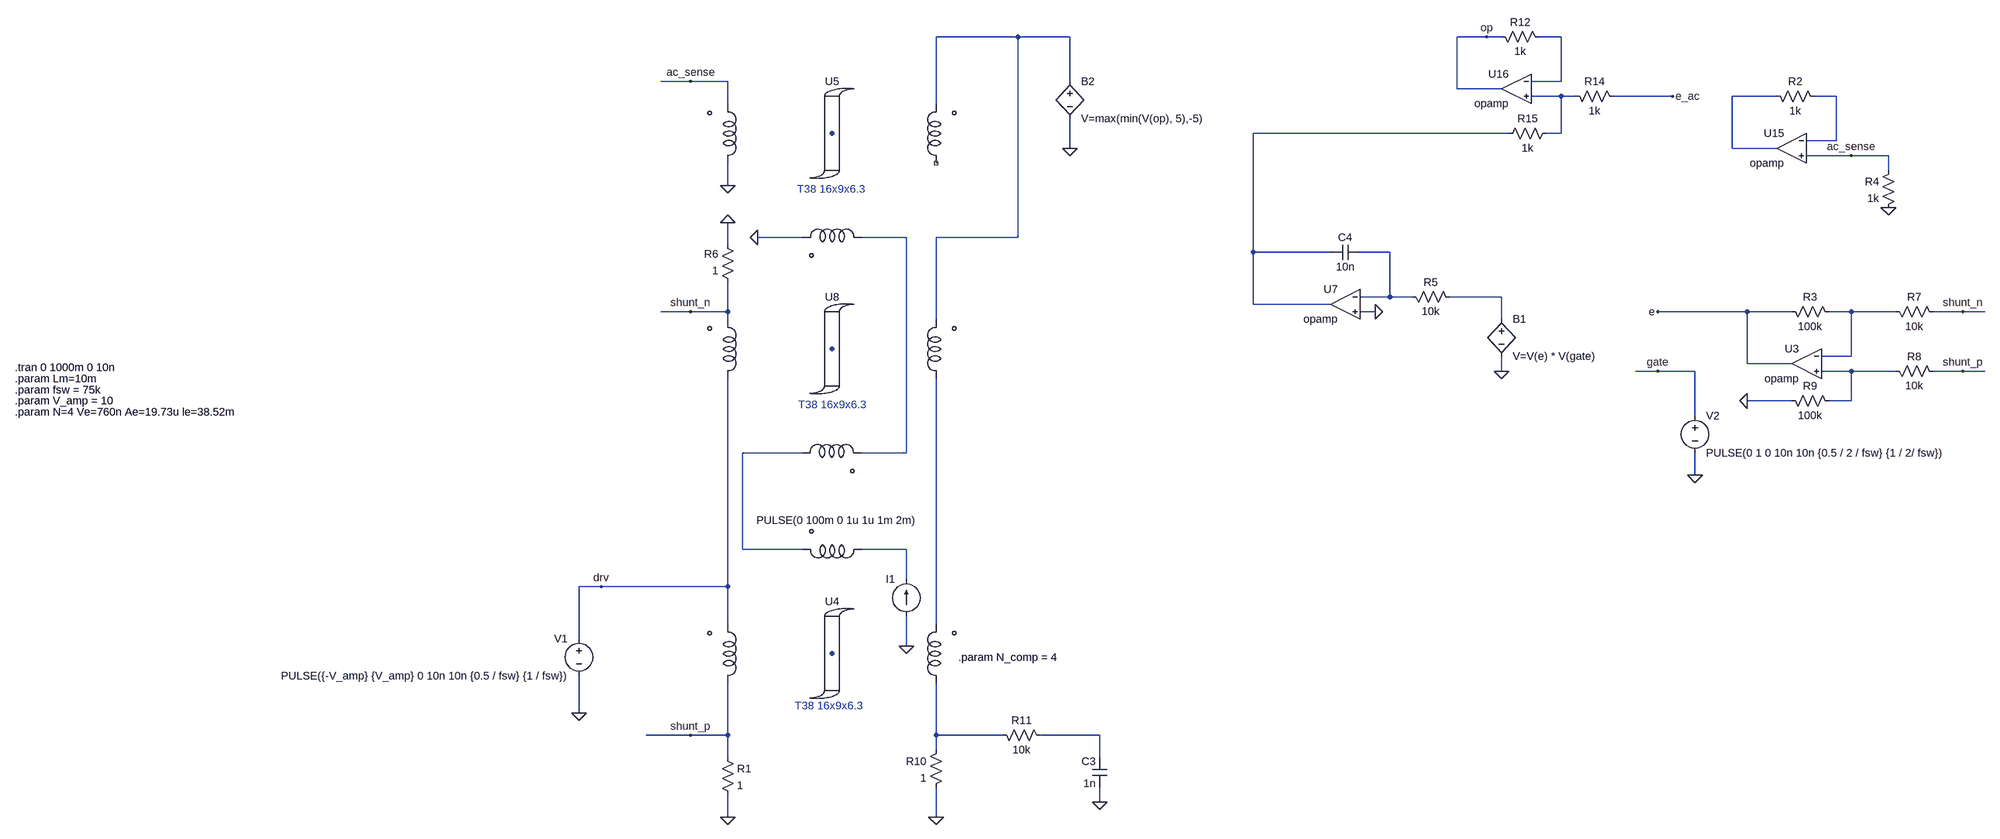
[diagram p0: schematic closed_loop_and_AC.asc]
closed_loop_and_AC.asc, the LTspice schematic file:
Version 4
SHEET 1 3936 1332
WIRE -192 -3136 -368 -3136
WIRE -80 -3136 -192 -3136
WIRE 1248 -3136 1184 -3136
WIRE 1280 -3136 1248 -3136
WIRE 1408 -3136 1360 -3136
WIRE -896 -3040 -960 -3040
WIRE -816 -3040 -896 -3040
WIRE -80 -3040 -80 -3136
WIRE 1408 -3040 1408 -3136
WIRE 1408 -3040 1344 -3040
WIRE 1184 -3024 1184 -3136
WIRE 1280 -3024 1184 -3024
WIRE 1408 -3008 1344 -3008
WIRE 1440 -3008 1408 -3008
WIRE 1648 -3008 1520 -3008
WIRE 1872 -3008 1776 -3008
WIRE 2000 -3008 1952 -3008
WIRE -816 -2992 -816 -3040
WIRE -368 -2992 -368 -3136
WIRE 1296 -2928 704 -2928
WIRE 1408 -2928 1408 -3008
WIRE 1408 -2928 1376 -2928
WIRE 2000 -2912 2000 -3008
WIRE 2000 -2912 1936 -2912
WIRE -80 -2896 -80 -2960
WIRE 1776 -2896 1776 -3008
WIRE 1872 -2896 1776 -2896
WIRE 2032 -2880 1936 -2880
WIRE 2112 -2880 2032 -2880
WIRE 2112 -2848 2112 -2880
WIRE -816 -2816 -816 -2864
WIRE -656 -2704 -752 -2704
WIRE -432 -2704 -528 -2704
WIRE -192 -2704 -192 -3136
WIRE -192 -2704 -368 -2704
WIRE -816 -2688 -816 -2736
WIRE 704 -2672 704 -2928
WIRE 912 -2672 704 -2672
WIRE 1040 -2672 976 -2672
WIRE 1040 -2576 1040 -2672
WIRE 1040 -2576 976 -2576
WIRE 1088 -2576 1040 -2576
WIRE 1280 -2576 1168 -2576
WIRE 704 -2560 704 -2672
WIRE 912 -2560 704 -2560
WIRE -896 -2544 -960 -2544
WIRE -816 -2544 -816 -2608
WIRE -816 -2544 -896 -2544
WIRE 1008 -2544 976 -2544
WIRE 1808 -2544 1616 -2544
WIRE 1904 -2544 1808 -2544
WIRE 2032 -2544 1984 -2544
WIRE 2128 -2544 2032 -2544
WIRE 2272 -2544 2208 -2544
WIRE 2320 -2544 2272 -2544
WIRE -816 -2528 -816 -2544
WIRE -368 -2528 -368 -2704
WIRE 1280 -2528 1280 -2576
WIRE 2032 -2448 2032 -2544
WIRE 2032 -2448 1968 -2448
WIRE 1808 -2432 1808 -2544
WIRE 1904 -2432 1808 -2432
WIRE 1280 -2416 1280 -2448
WIRE 1616 -2416 1568 -2416
WIRE 1696 -2416 1616 -2416
WIRE 2032 -2416 1968 -2416
WIRE 2128 -2416 2032 -2416
WIRE 2272 -2416 2208 -2416
WIRE 2320 -2416 2272 -2416
WIRE 1904 -2352 1808 -2352
WIRE 2032 -2352 2032 -2416
WIRE 2032 -2352 1984 -2352
WIRE 1696 -2320 1696 -2416
WIRE -656 -2240 -784 -2240
WIRE -432 -2240 -432 -2704
WIRE -432 -2240 -528 -2240
WIRE 1696 -2192 1696 -2240
WIRE -784 -2032 -784 -2240
WIRE -656 -2032 -784 -2032
WIRE -432 -2032 -528 -2032
WIRE -432 -1968 -432 -2032
WIRE -1088 -1952 -1136 -1952
WIRE -816 -1952 -816 -2400
WIRE -816 -1952 -1088 -1952
WIRE -816 -1872 -816 -1952
WIRE -368 -1872 -368 -2400
WIRE -1136 -1840 -1136 -1952
WIRE -432 -1824 -432 -1888
WIRE -1136 -1680 -1136 -1760
WIRE -896 -1632 -992 -1632
WIRE -816 -1632 -816 -1744
WIRE -816 -1632 -896 -1632
WIRE -368 -1632 -368 -1744
WIRE -224 -1632 -368 -1632
WIRE -16 -1632 -144 -1632
WIRE -368 -1600 -368 -1632
WIRE -816 -1584 -816 -1632
WIRE -16 -1584 -16 -1632
WIRE -16 -1488 -16 -1520
WIRE -816 -1456 -816 -1504
WIRE -368 -1456 -368 -1520
FLAG -1136 -1680 0
FLAG 1696 -2192 0
FLAG -1088 -1952 drv
FLAG -816 -2736 0
FLAG 1808 -2352 0
FLAG -896 -1632 shunt_p
FLAG 2272 -2416 shunt_p
FLAG 2272 -2544 shunt_n
FLAG -896 -2544 shunt_n
FLAG -368 -1456 0
FLAG -816 -1456 0
FLAG 1616 -2416 gate
FLAG 1616 -2544 e
FLAG 1280 -2416 0
FLAG -432 -1824 0
FLAG 1008 -2544 0
FLAG -80 -2896 0
FLAG -16 -1488 0
FLAG -752 -2704 0
FLAG -816 -2816 0
FLAG -896 -3040 ac_sense
FLAG 2032 -2880 ac_sense
FLAG 1648 -3008 e_ac
FLAG 1248 -3136 op
FLAG 2112 -2768 0
SYMBOL voltage -1136 -1856 M0
WINDOW 123 0 0 Left 0
WINDOW 39 0 0 Left 0
SYMATTR InstName V1
SYMATTR Value PULSE({-V_amp} {V_amp} 0 10n 10n {0.5 / fsw} {1 / fsw})
SYMBOL Winding -816 -1808 R0
WINDOW 0 -93 39 Invisible 2
WINDOW 39 -225 76 Invisible 2
WINDOW 3 -98 42 Invisible 2
SYMATTR InstName U1
SYMATTR SpiceLine n={N} L=10n Rs=1m Rp=100Meg
SYMBOL Core_Chan -592 -1808 R0
WINDOW 3 41 88 Invisible 2
WINDOW 39 13 112 Invisible 2
WINDOW 0 1 -96 Bottom 2
SYMATTR SpiceLine Bs=0.43 Br=0.1 Hc=8
SYMATTR InstName U4
SYMATTR SpiceLine2 A={Ae} Lm={le} Lg=0 Rp=1Meg
SYMBOL res -832 -1600 R0
SYMATTR InstName R1
SYMATTR Value 1
SYMBOL Winding -592 -2032 M90
WINDOW 0 -93 39 Invisible 2
WINDOW 39 -196 73 Invisible 2
WINDOW 3 -98 42 Invisible 2
SYMATTR InstName U2
SYMATTR SpiceLine n={1} L=10n Rs=1m Rp=100k
SYMBOL current -432 -1888 R180
WINDOW 0 24 80 Left 2
WINDOW 3 150 207 Center 2
WINDOW 123 0 0 Left 0
WINDOW 39 0 0 Left 0
SYMATTR InstName I1
SYMATTR Value PULSE(0 100m 0 1u 1u 1m 2m)
SYMBOL voltage 1696 -2336 R0
WINDOW 123 0 0 Left 0
WINDOW 39 0 0 Left 0
SYMATTR InstName V2
SYMATTR Value PULSE(0 1 0 10n 10n {0.5 / 2 / fsw} {1 / 2/ fsw})
SYMBOL opamp 944 -2624 M0
SYMATTR InstName U7
SYMBOL Winding -816 -2464 R0
WINDOW 0 221 26 Invisible 2
WINDOW 39 259 -62 Invisible 2
WINDOW 3 214 -32 Invisible 2
SYMATTR InstName U6
SYMATTR SpiceLine n={N} L=10n Rs=1m Rp=100Meg
SYMBOL Core_Chan -592 -2464 R0
WINDOW 3 41 88 Invisible 2
WINDOW 39 13 112 Invisible 2
WINDOW 0 1 -96 Bottom 2
SYMATTR SpiceLine Bs=0.43 Br=0.1 Hc=8
SYMATTR InstName U8
SYMATTR SpiceLine2 A={Ae} Lm={le} Lg=0 Rp=1Meg
SYMBOL res -800 -2592 R180
WINDOW 0 36 76 Left 2
WINDOW 3 36 40 Left 2
SYMATTR InstName R6
SYMATTR Value 1
SYMBOL Winding -592 -2240 M270
WINDOW 0 -93 39 Invisible 2
WINDOW 39 -196 73 Invisible 2
WINDOW 3 -98 42 Invisible 2
SYMATTR InstName U9
SYMATTR SpiceLine n={1} L=10n Rs=1m Rp=100k
SYMBOL opamp 1936 -2496 M0
SYMATTR InstName U3
SYMBOL res 1888 -2560 M90
WINDOW 0 0 56 VBottom 2
WINDOW 3 32 56 VTop 2
SYMATTR InstName R3
SYMATTR Value 100k
SYMBOL res 2112 -2560 M90
WINDOW 0 0 56 VBottom 2
WINDOW 3 32 56 VTop 2
SYMATTR InstName R7
SYMATTR Value 10k
SYMBOL res 2112 -2432 M90
WINDOW 0 0 56 VBottom 2
WINDOW 3 32 56 VTop 2
SYMATTR InstName R8
SYMATTR Value 10k
SYMBOL res 1888 -2368 M90
WINDOW 0 0 56 VBottom 2
WINDOW 3 32 56 VTop 2
SYMATTR InstName R9
SYMATTR Value 100k
SYMBOL Winding -368 -1808 M0
WINDOW 0 -93 39 Invisible 2
WINDOW 39 -225 76 Invisible 2
WINDOW 3 -98 42 Invisible 2
SYMATTR InstName U10
SYMATTR SpiceLine n={N_comp} L=10n Rs=1m Rp=100Meg
SYMBOL Winding -368 -2464 M0
WINDOW 0 221 26 Invisible 2
WINDOW 39 259 -62 Invisible 2
WINDOW 3 214 -32 Invisible 2
SYMATTR InstName U11
SYMATTR SpiceLine n={N_comp} L=10n Rs=1m Rp=100Meg
SYMBOL res -352 -1616 M0
SYMATTR InstName R10
SYMATTR Value 1
SYMBOL bv 1280 -2544 R0
SYMATTR InstName B1
SYMATTR Value V=V(e) * V(gate)
SYMBOL res 1072 -2592 M90
WINDOW 0 0 56 VBottom 2
WINDOW 3 32 56 VTop 2
SYMATTR InstName R5
SYMATTR Value 10k
SYMBOL bv -80 -3056 R0
SYMATTR InstName B2
SYMATTR Value V=max(min(V(op), 5),-5)
SYMBOL cap 976 -2688 R90
WINDOW 0 0 32 VBottom 2
WINDOW 3 32 32 VTop 2
SYMATTR InstName C4
SYMATTR Value 10n
SYMBOL cap 0 -1584 M0
SYMATTR InstName C3
SYMATTR Value 1n
SYMBOL res -240 -1648 M90
WINDOW 0 0 56 VBottom 2
WINDOW 3 32 56 VTop 2
SYMATTR InstName R11
SYMATTR Value 10k
SYMBOL Core_Chan -592 -2928 R0
WINDOW 3 41 88 Invisible 2
WINDOW 39 13 112 Invisible 2
WINDOW 0 1 -96 Bottom 2
SYMATTR SpiceLine Bs=0.43 Br=0.1 Hc=8
SYMATTR InstName U5
SYMATTR SpiceLine2 A={Ae} Lm={le} Lg=0 Rp=1Meg
SYMBOL Winding -592 -2704 R270
WINDOW 0 -93 39 Invisible 2
WINDOW 39 -196 73 Invisible 2
WINDOW 3 -98 42 Invisible 2
SYMATTR InstName U12
SYMATTR SpiceLine n={1} L=10n Rs=1m Rp=100k
SYMBOL Winding -368 -2928 M0
WINDOW 0 221 26 Invisible 2
WINDOW 39 259 -62 Invisible 2
WINDOW 3 214 -32 Invisible 2
SYMATTR InstName U13
SYMATTR SpiceLine n={20} L=10n Rs=1m Rp=100Meg
SYMBOL Winding -816 -2928 R0
WINDOW 0 221 26 Invisible 2
WINDOW 39 259 -62 Invisible 2
WINDOW 3 214 -32 Invisible 2
SYMATTR InstName U14
SYMATTR SpiceLine n={20} L=10n Rs=1m Rp=100Meg
SYMBOL opamp 1904 -2960 M0
SYMATTR InstName U15
SYMBOL res 1856 -3024 M90
WINDOW 0 0 56 VBottom 2
WINDOW 3 32 56 VTop 2
SYMATTR InstName R2
SYMATTR Value 1k
SYMBOL opamp 1312 -3088 M0
SYMATTR InstName U16
SYMBOL res 1264 -3152 M90
WINDOW 0 0 56 VBottom 2
WINDOW 3 32 56 VTop 2
SYMATTR InstName R12
SYMATTR Value 1k
SYMBOL res 1424 -3024 M90
WINDOW 0 0 56 VBottom 2
WINDOW 3 32 56 VTop 2
SYMATTR InstName R14
SYMATTR Value 1k
SYMBOL res 1392 -2944 R90
WINDOW 0 0 56 VBottom 2
WINDOW 3 32 56 VTop 2
SYMATTR InstName R15
SYMATTR Value 1k
SYMBOL res 2128 -2864 M0
SYMATTR InstName R4
SYMATTR Value 1k
TEXT -2856 -2424 Left 2 !.tran 0 1000m 0 10n
TEXT -2856 -2328 Left 2 !.param N=4 Ve=760n Ae=19.73u le=38.52m
TEXT -2856 -2400 Left 2 !.param Lm=10m
TEXT -2856 -2376 Left 2 !.param fsw = 75k
TEXT -2856 -2352 Left 2 !.param V_amp = 10
TEXT -672 -1696 Left 2 ;T38 16x9x6.3
TEXT -320 -1800 Left 2 !.param N_comp = 4
TEXT -664 -2344 Left 2 ;T38 16x9x6.3
TEXT -520 -2808 Right 2 ;T38 16x9x6.3

The netlist it stands for:
* closed_loop_and_AC.asc
V1 drv 0 PULSE({-V_amp} {V_amp} 0 10n 10n {0.5 / fsw} {1 / fsw})
XU1 shunt_p drv P001 Winding n={N} L=10n Rs=1m Rp=100Meg  ; pins s f c
XU4 P001 Core_Chan Bs=0.43 Br=0.1 Hc=8 A={Ae} Lm={le} Lg=0 Rp=1Meg  ; pins C
R1 shunt_p 0 1
XU2 N013 N012 P001 Winding n={1} L=10n Rs=1m Rp=100k  ; pins s f c
I1 0 N013 PULSE(0 100m 0 1u 1u 1m 2m)
V2 gate 0 PULSE(0 1 0 10n 10n {0.5 / 2 / fsw} {1 / 2/ fsw})
XU7 N008 0 N006 opamp Aol=100K GBW=10Meg  ; pins invin noninvin out
XU6 drv shunt_n P002 Winding n={N} L=10n Rs=1m Rp=100Meg  ; pins s f c
XU8 P002 Core_Chan Bs=0.43 Br=0.1 Hc=8 A={Ae} Lm={le} Lg=0 Rp=1Meg  ; pins C
R6 shunt_n 0 1
XU9 N012 N007 P002 Winding n={1} L=10n Rs=1m Rp=100k  ; pins s f c
XU3 N010 N011 e opamp Aol=100K GBW=10Meg  ; pins invin noninvin out
R3 e N010 100k
R7 N010 shunt_n 10k
R8 N011 shunt_p 10k
R9 0 N011 100k
XU10 N015 N014 P001 Winding n={N_comp} L=10n Rs=1m Rp=100Meg  ; pins s f c
XU11 N014 N001 P002 Winding n={N_comp} L=10n Rs=1m Rp=100Meg  ; pins s f c
R10 N015 0 1
B1 N009 0 V=V(e) * V(gate)
R5 N008 N009 10k
B2 N001 0 V=max(min(V(op), 5),-5)
C4 N008 N006 10n
C3 N016 0 1n
R11 N015 N016 10k
XU5 P003 Core_Chan Bs=0.43 Br=0.1 Hc=8 A={Ae} Lm={le} Lg=0 Rp=1Meg  ; pins C
XU12 N007 0 P003 Winding n={1} L=10n Rs=1m Rp=100k  ; pins s f c
XU13 NC_01 N001 P003 Winding n={20} L=10n Rs=1m Rp=100Meg  ; pins s f c
XU14 0 ac_sense P003 Winding n={20} L=10n Rs=1m Rp=100Meg  ; pins s f c
XU15 N005 ac_sense N004 opamp Aol=100K GBW=10Meg  ; pins invin noninvin out
R2 N004 N005 1k
XU16 N002 N003 op opamp Aol=100K GBW=10Meg  ; pins invin noninvin out
R12 op N002 1k
R14 N003 e_ac 1k
R15 N003 N006 1k
R4 ac_sense 0 1k
.tran 0 1000m 0 10n
.param N=4 Ve=760n Ae=19.73u le=38.52m
.param Lm=10m
.param fsw = 75k
.param V_amp = 10
* T38 16x9x6.3
.param N_comp = 4
* T38 16x9x6.3
* T38 16x9x6.3
.lib Winding.lib
.lib Core_Chan.lib
.backanno
.end